# Altium schematic sheet MCU_WASH_MACHINE.SchDoc (part 1 of 3)
size 1270 x 558 mm; SheetNumber: 2; SheetTotal: 2
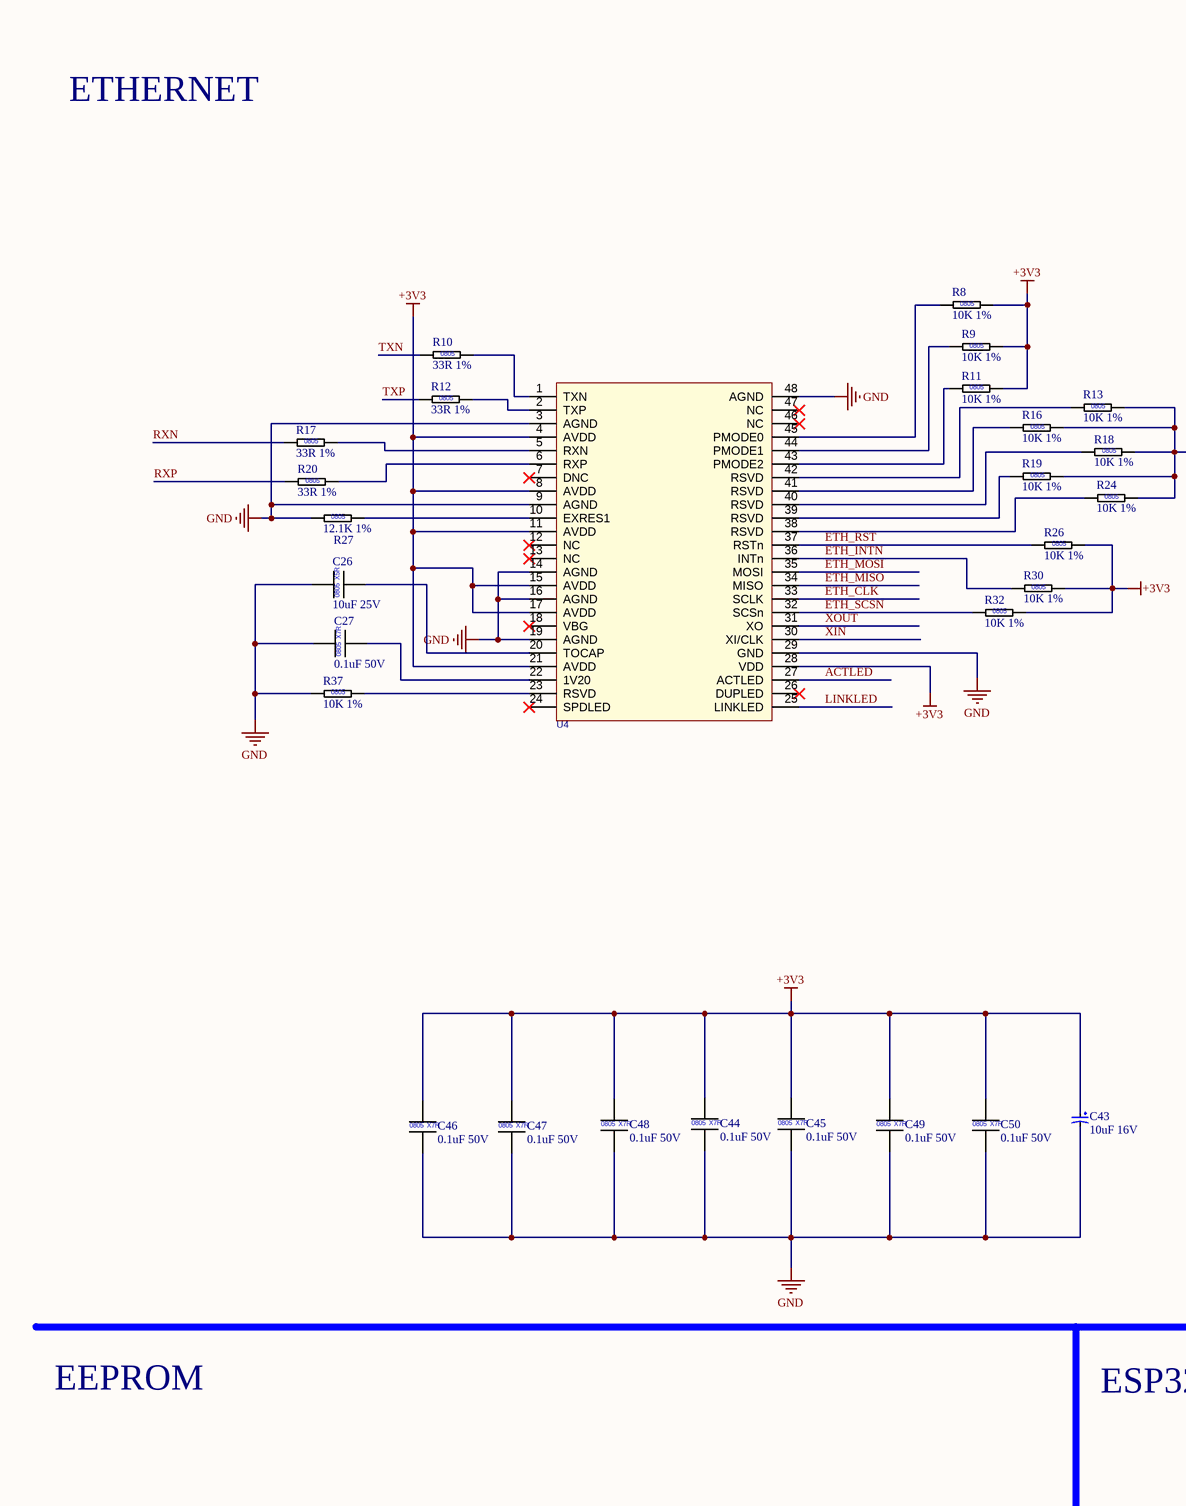
[diagram p0: MCU_WASH_MACHINE.SchDoc, top column 1 of 4]
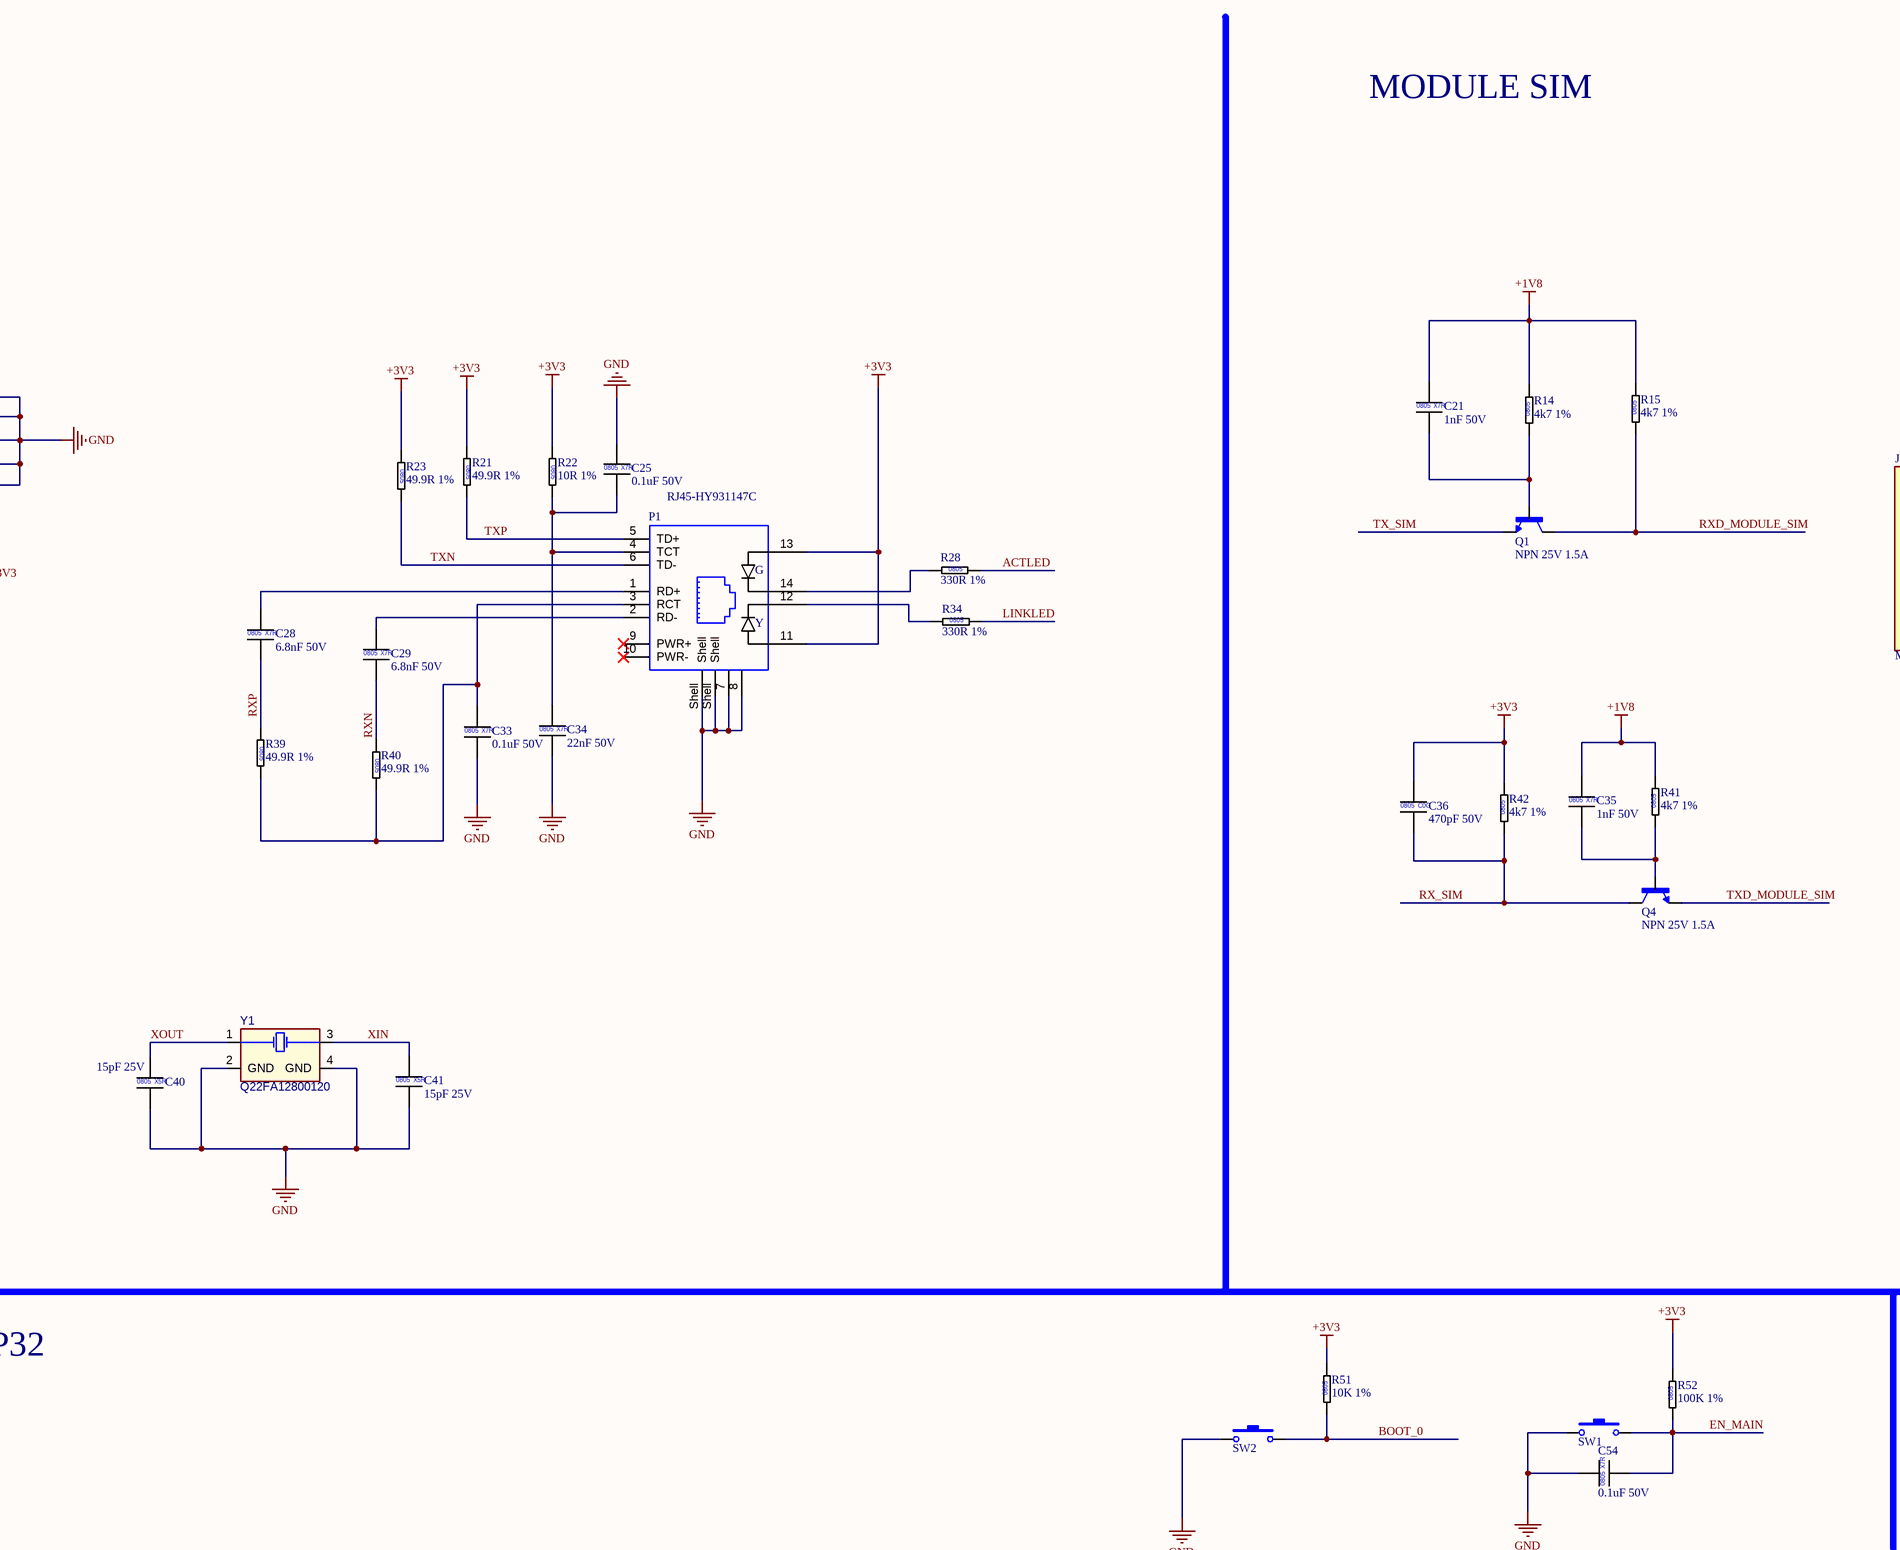
[diagram p1: MCU_WASH_MACHINE.SchDoc, top column 2 of 4]
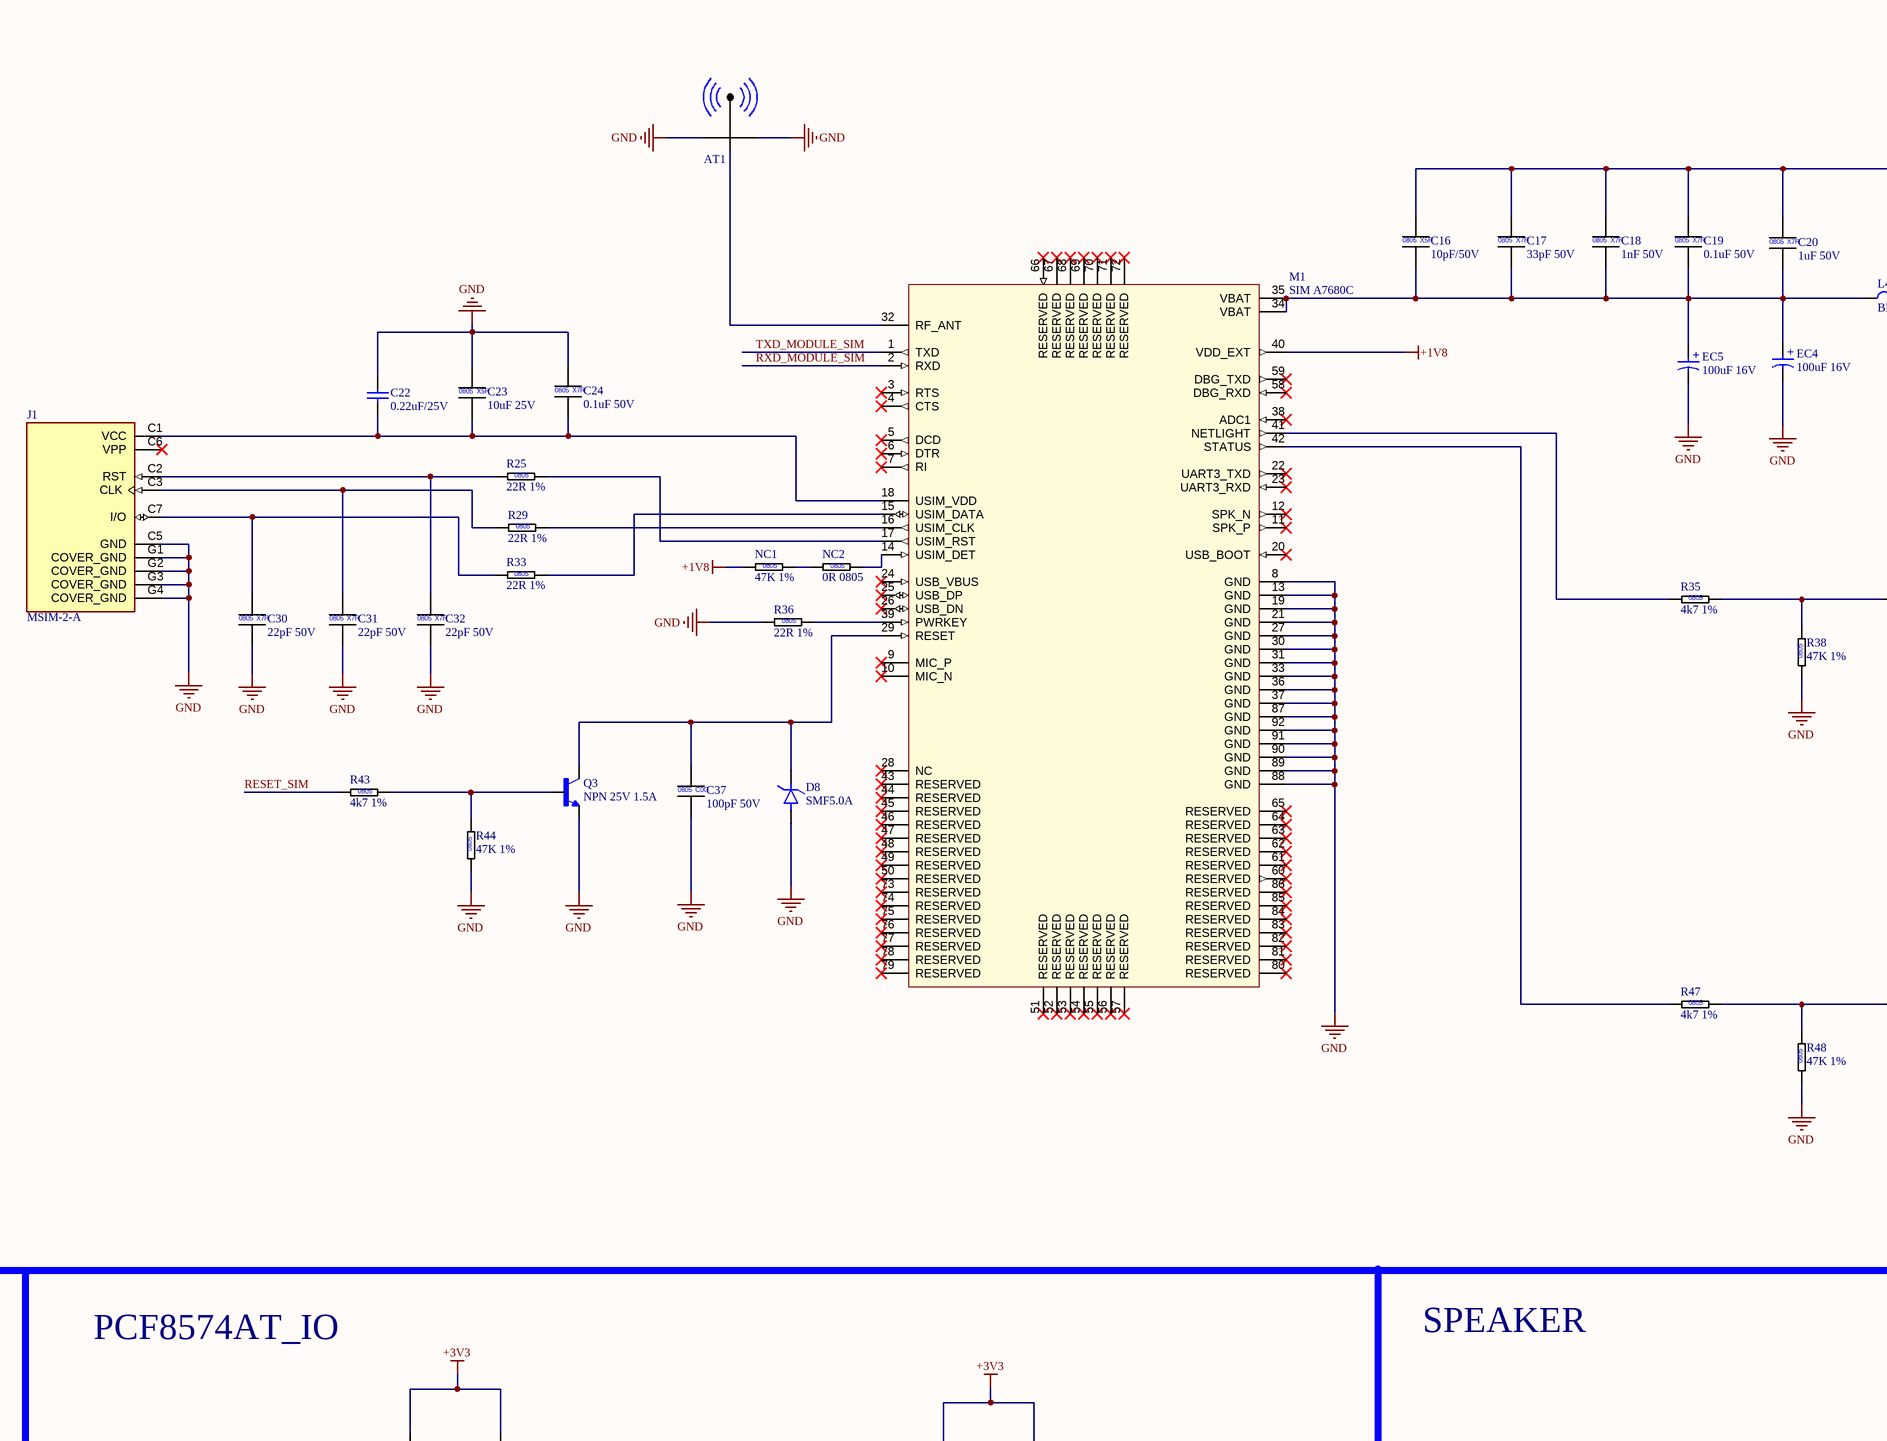
[diagram p2: MCU_WASH_MACHINE.SchDoc, top column 3 of 4]
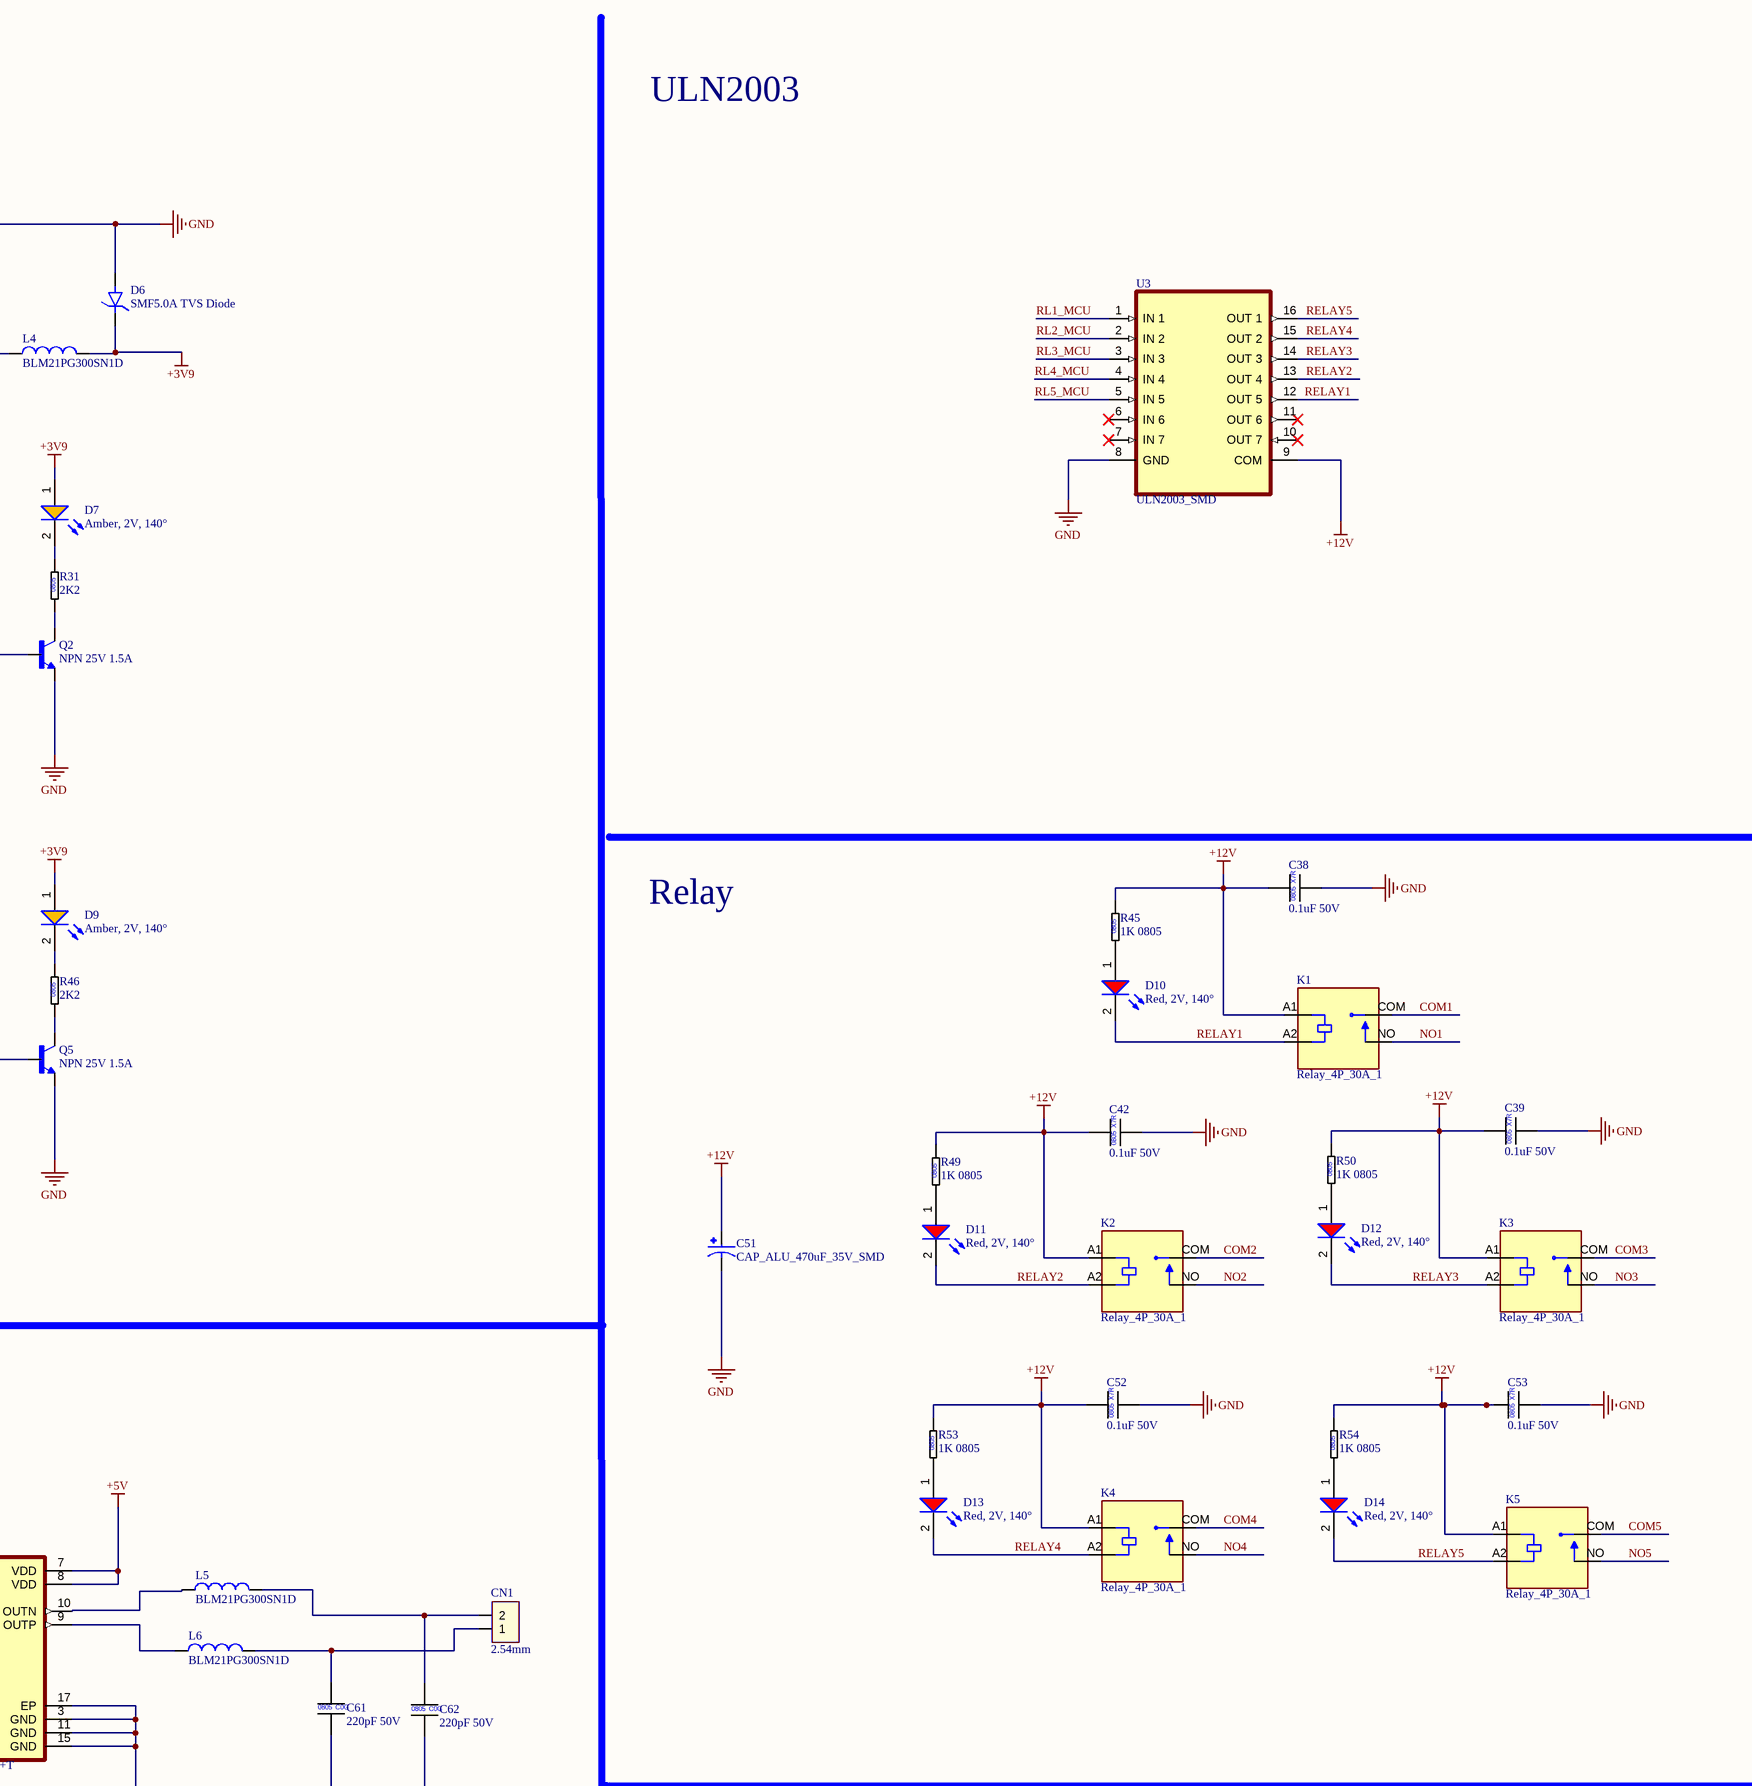
[diagram p3: MCU_WASH_MACHINE.SchDoc, top column 4 of 4]
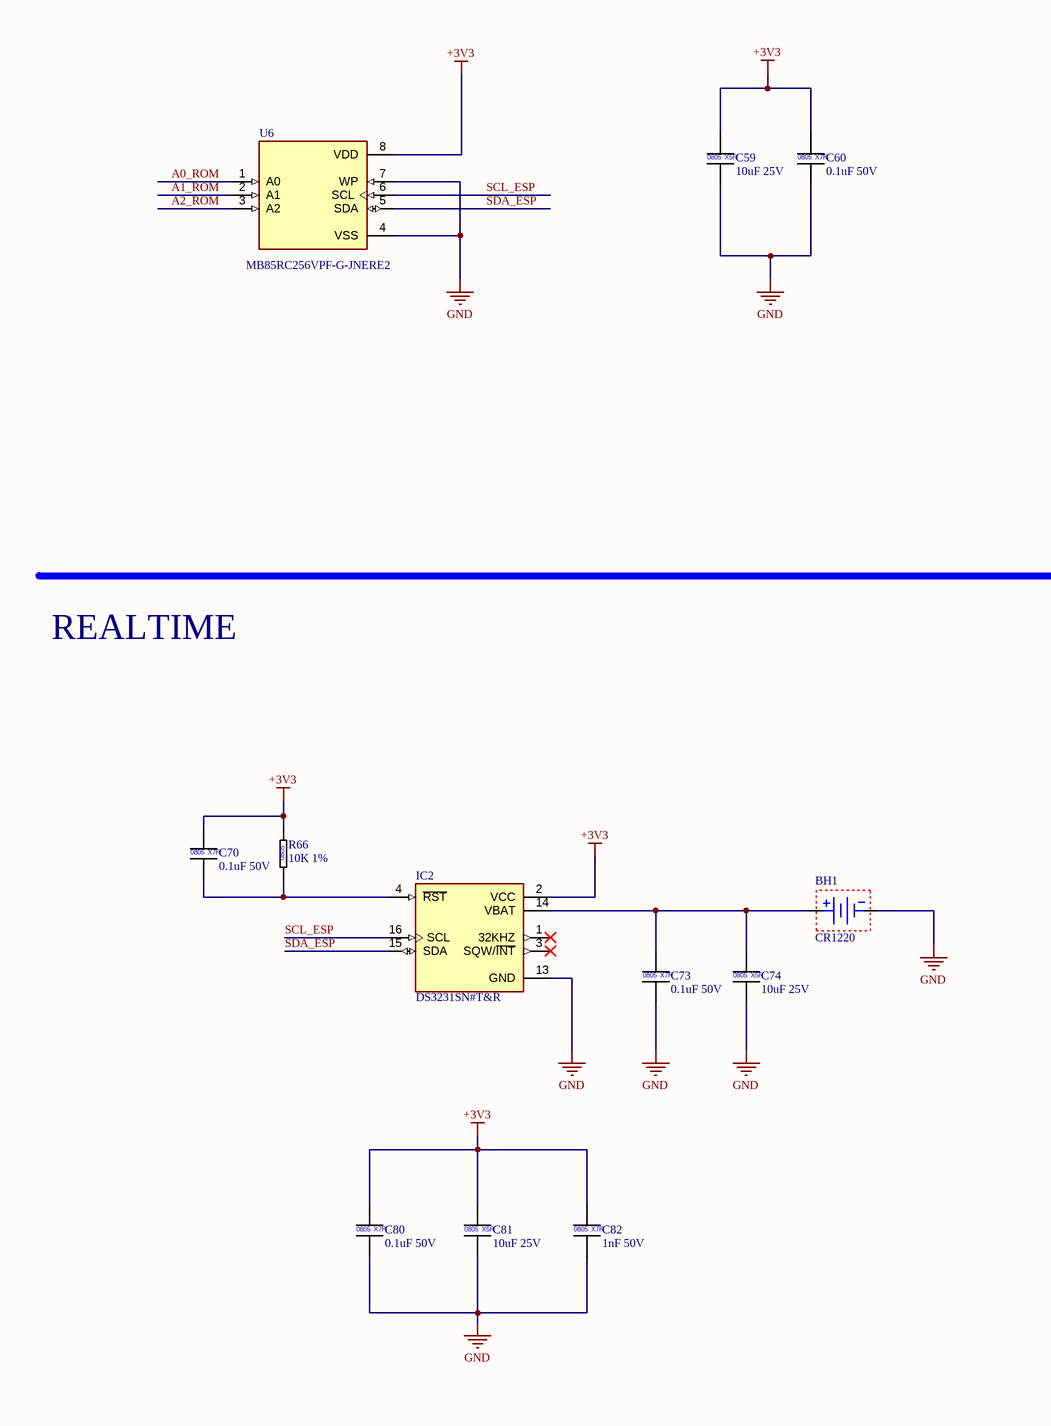
[diagram p4: MCU_WASH_MACHINE.SchDoc, bottom column 1 of 4]
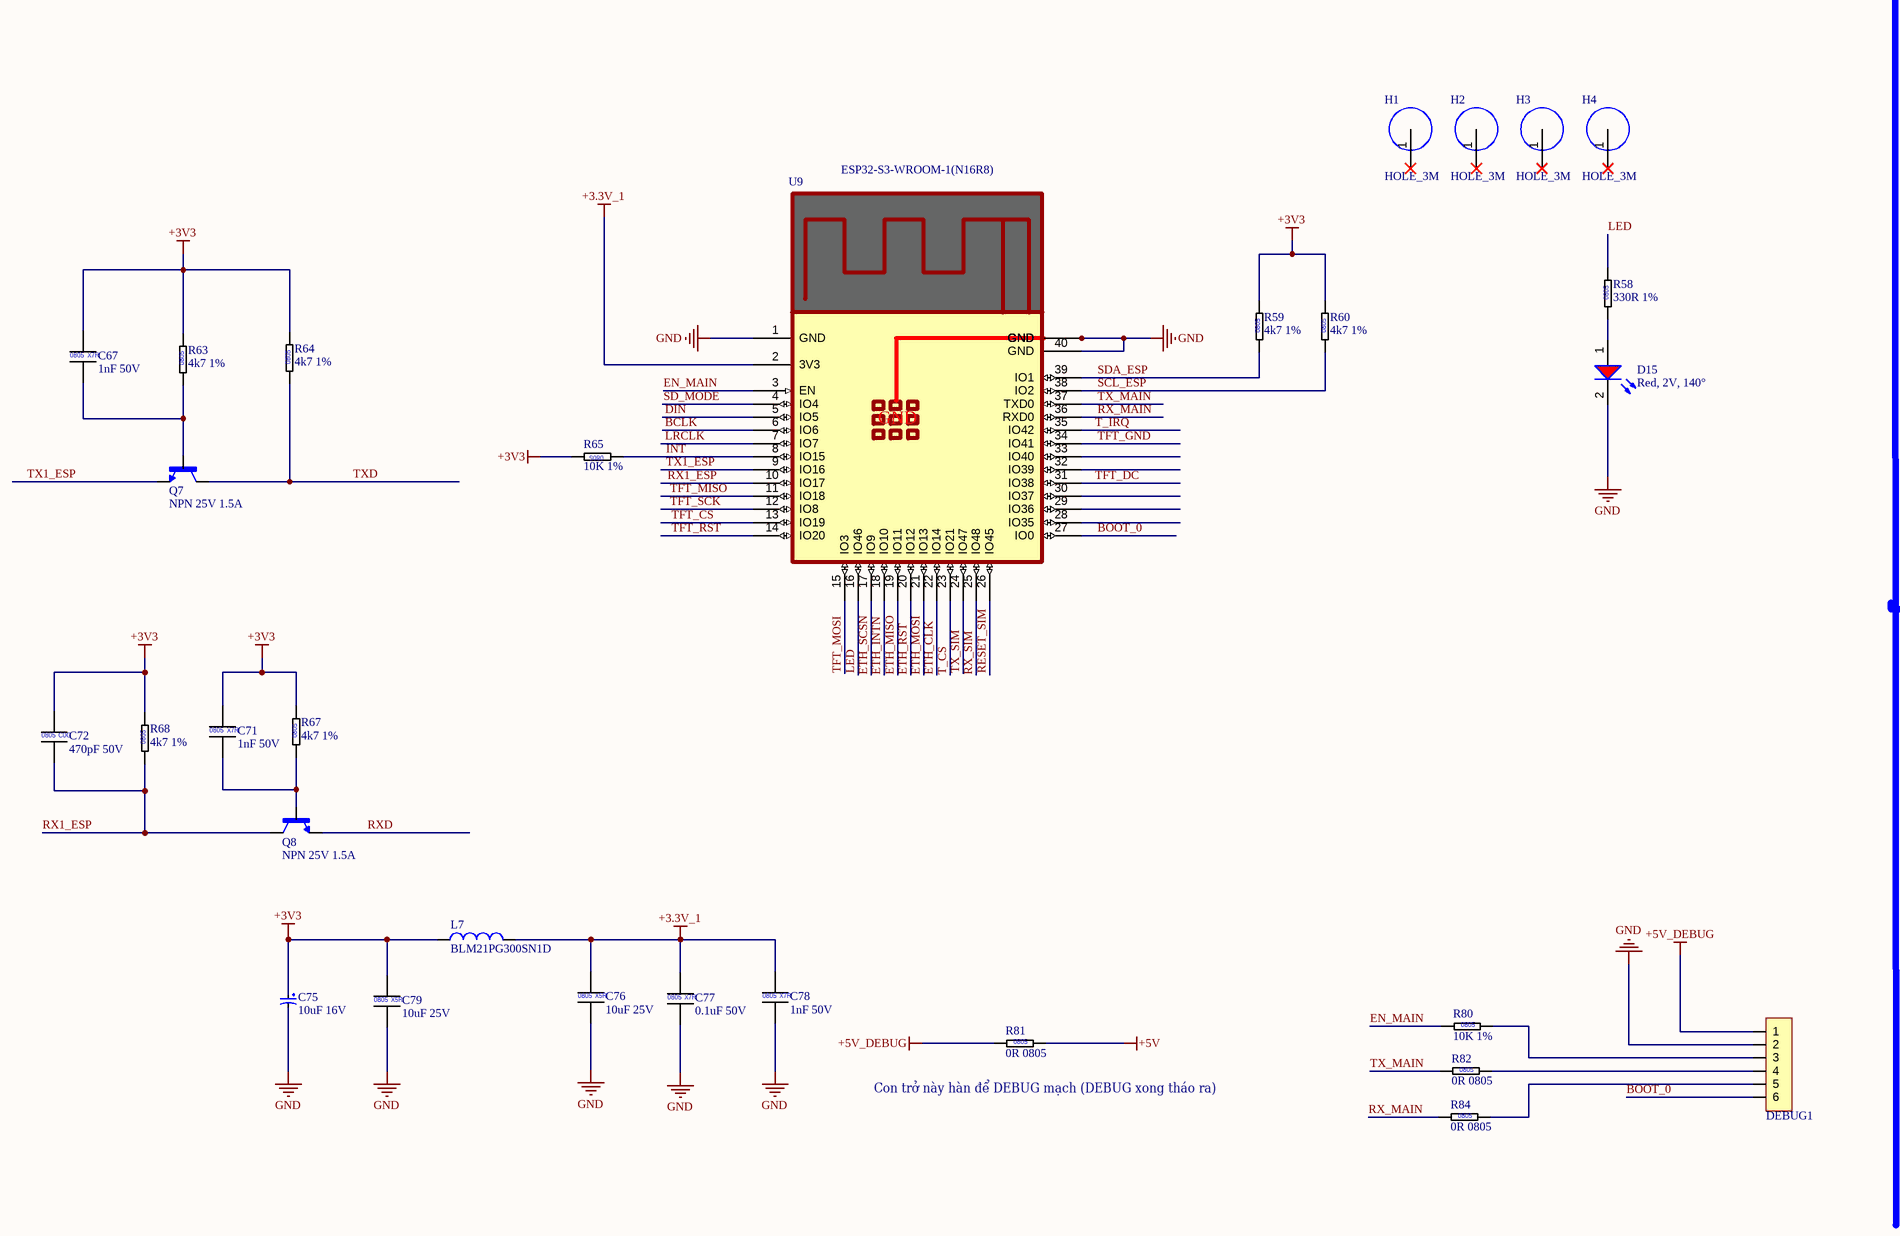
[diagram p5: MCU_WASH_MACHINE.SchDoc, bottom column 2 of 4]
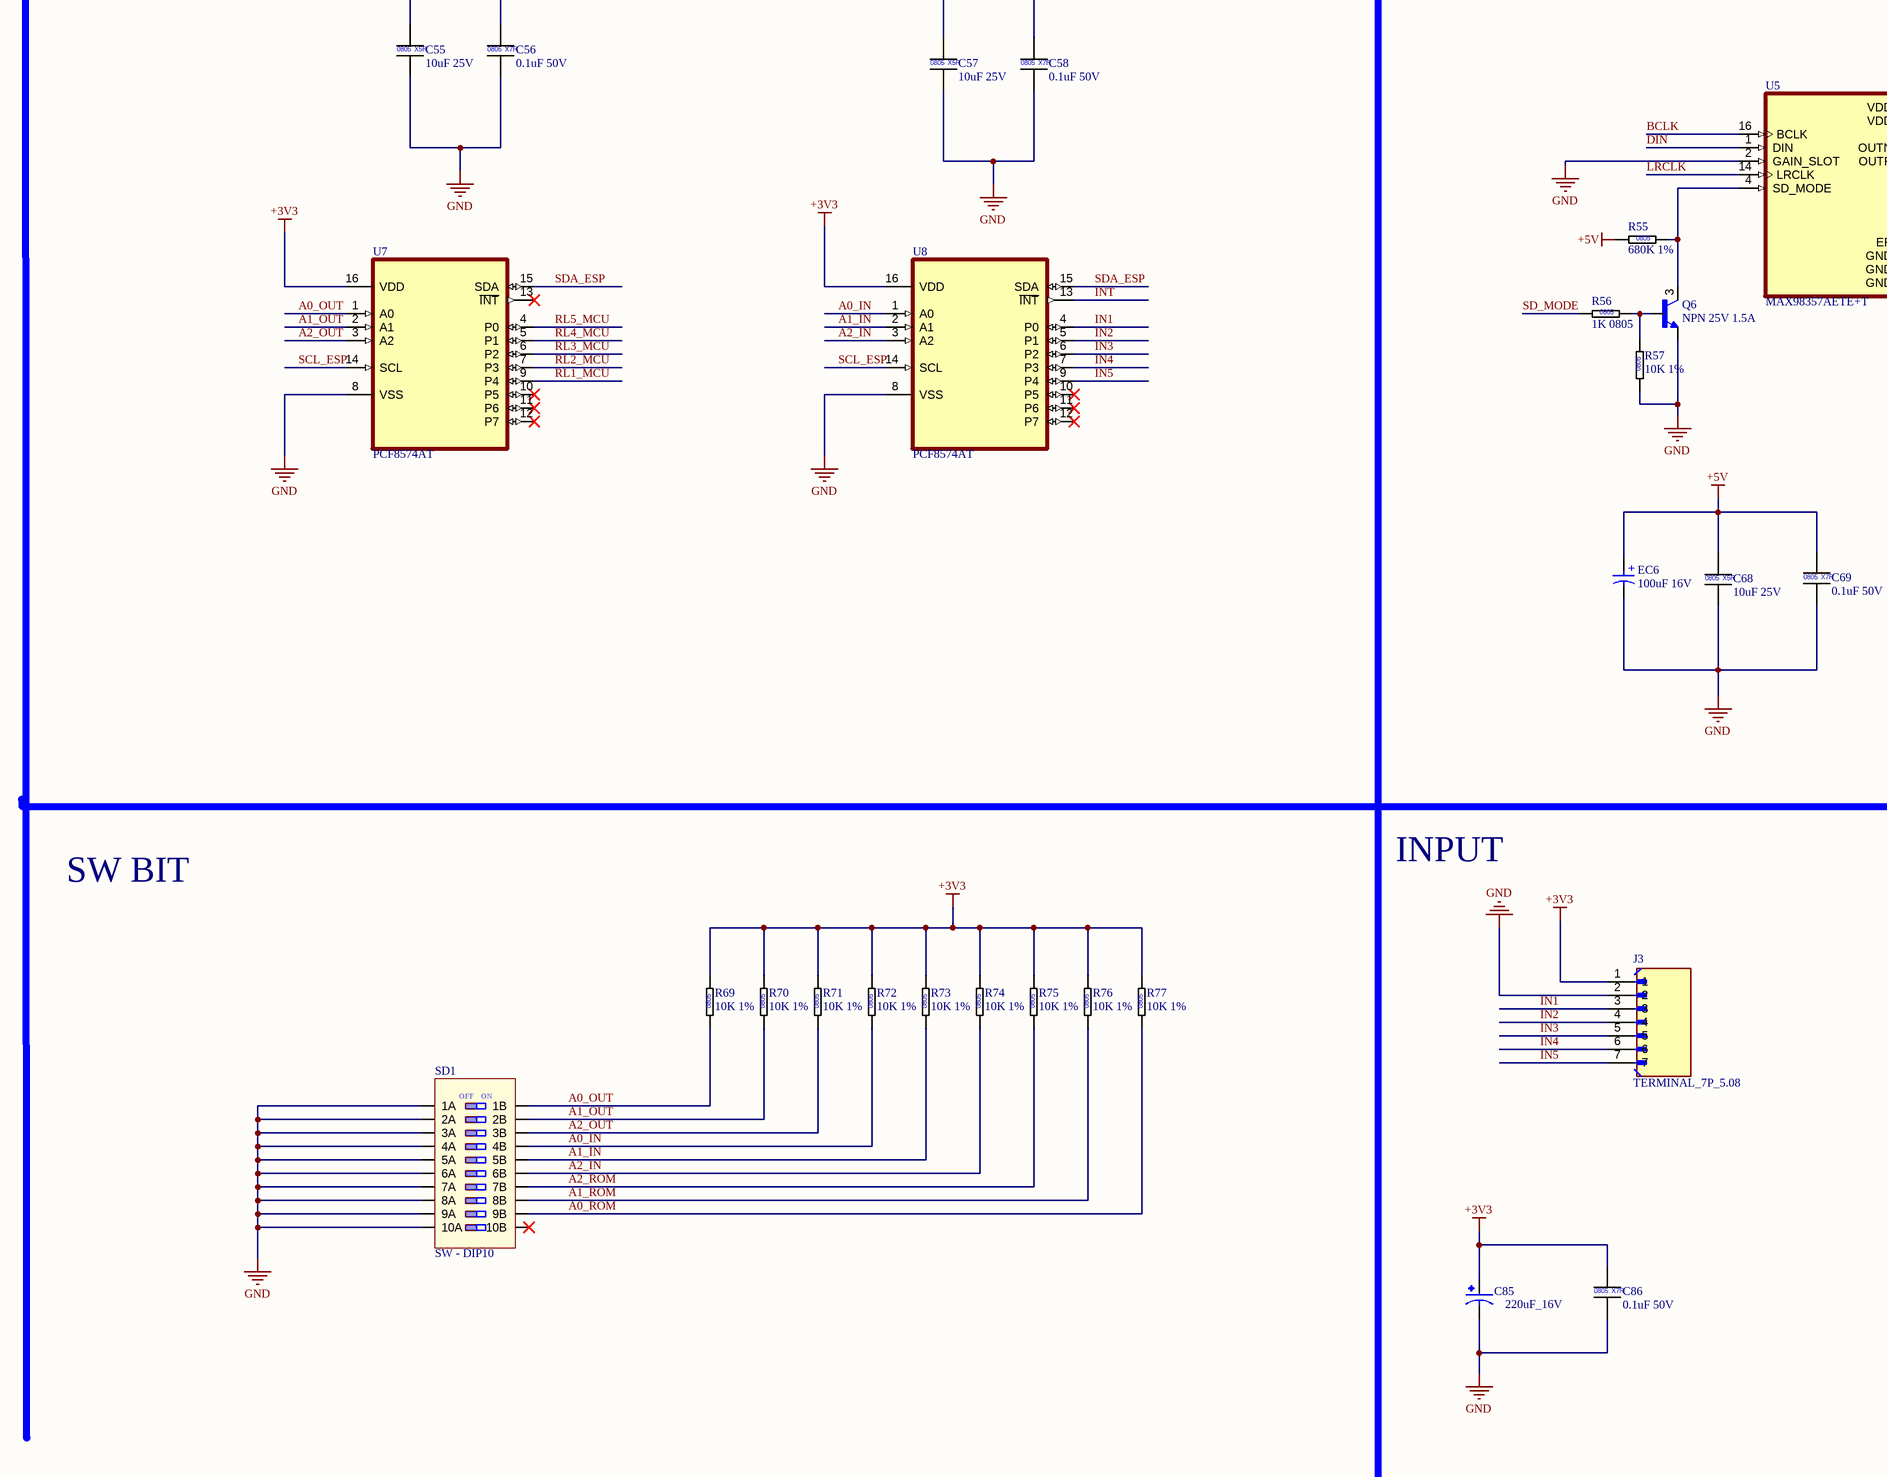
[diagram p6: MCU_WASH_MACHINE.SchDoc, bottom column 3 of 4]
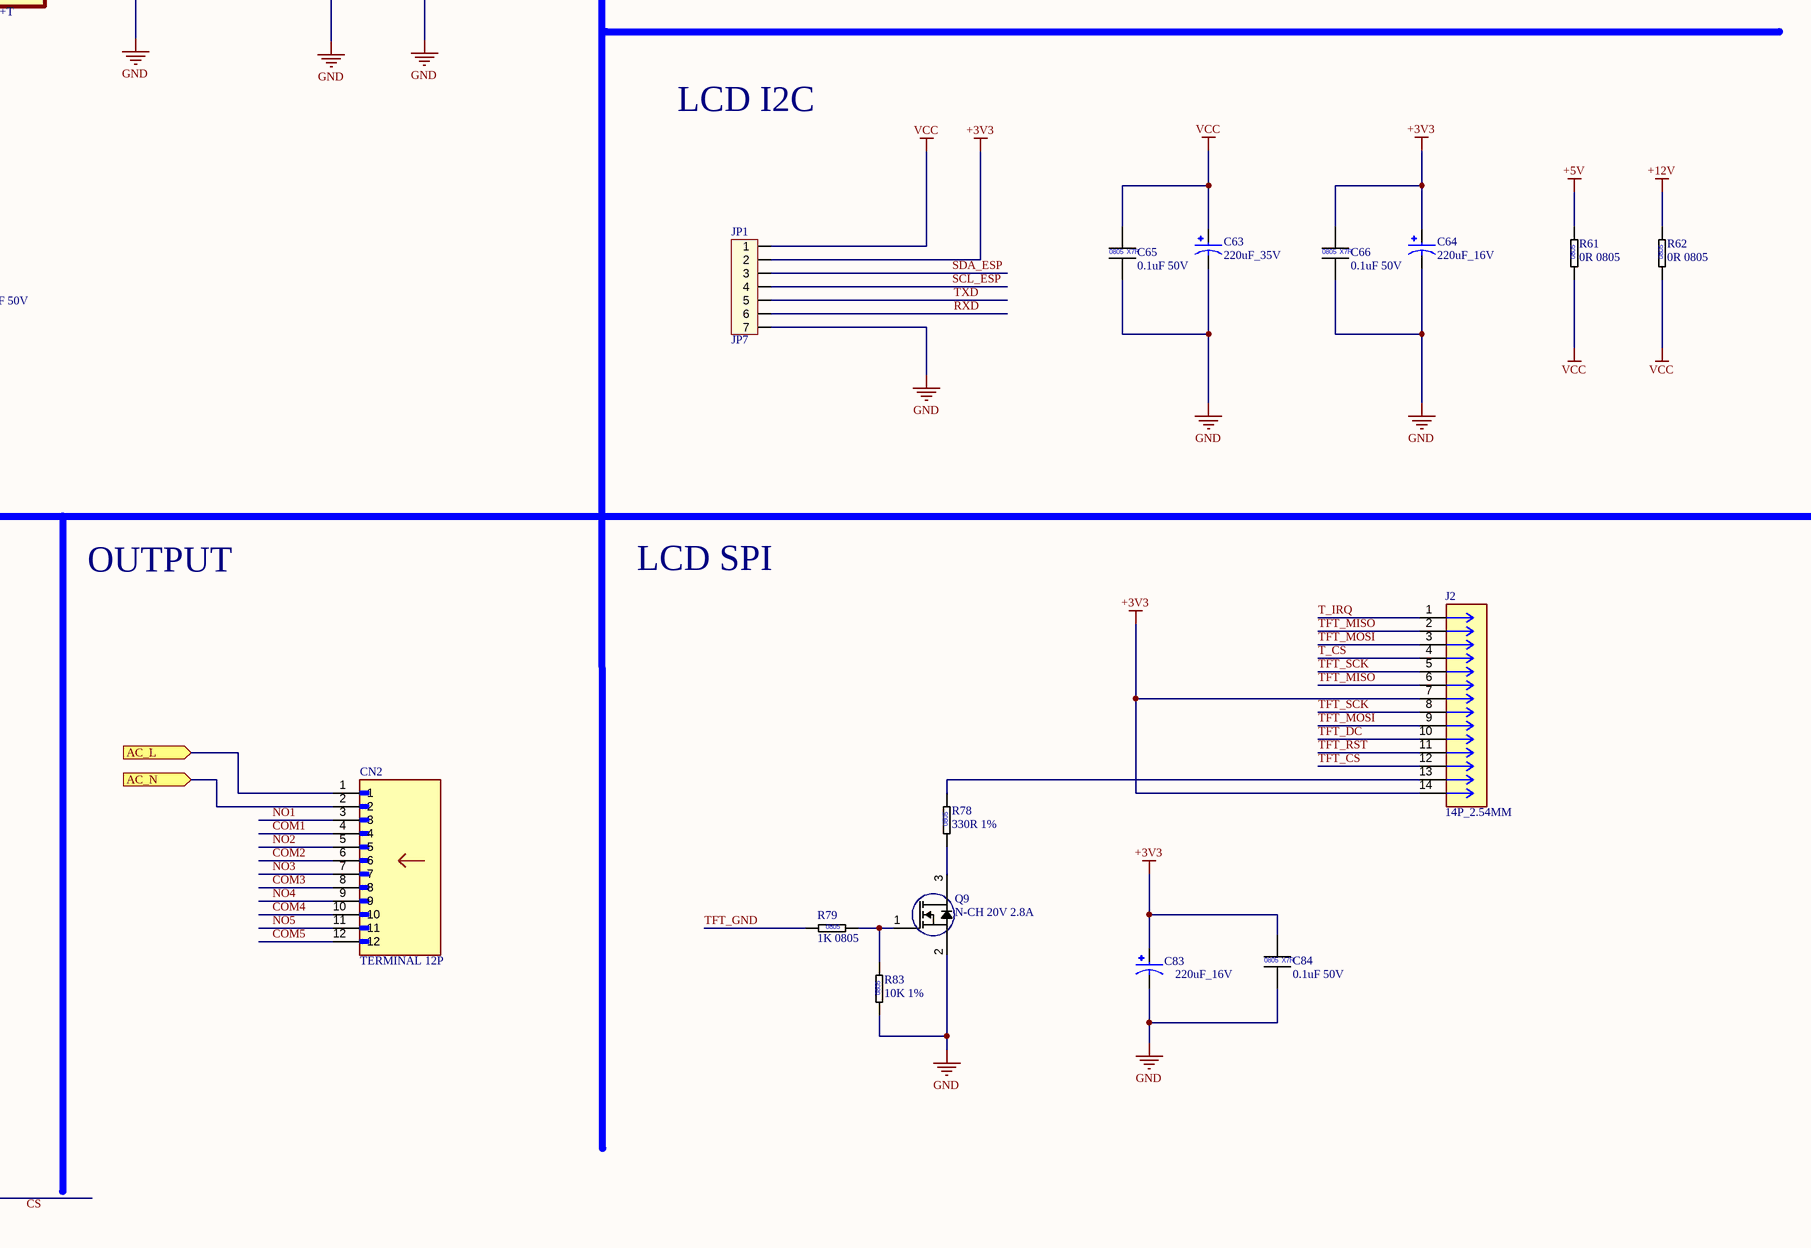
[diagram p7: MCU_WASH_MACHINE.SchDoc, bottom column 4 of 4]

## Parts
AT1  Antenna_IPEX  [IPEX]  (value not drawn)
BH1  CR1220  [BATT_HOLDER_COIL12.5MM]
C16  10pF/50V  [CAP-CER_0805_L2W1.25H0.6_Wave]
C17  33pF 50V  [CAP-CER_0805_L2W1.25H0.6_Wave]
C18  1nF 50V  [CAP-CER_0805_L2W1.25H0.6_Wave]
C19  0.1uF 50V  [CAP-CER_0805_L2W1.25H0.6_Wave]
C20  1uF 50V  [CAP-CER_0805_L2W1.25H0.8_Wave]
C21  1nF 50V  [CAP-CER_0805_L2W1.25H0.6_Wave]
C22  0.22uF/25V  [CAP-CER_0805_L2W1.25H0.6_Wave]
C23  10uF 25V  [CAP-CER_0805_L2W1.25H0.8_Wave]
C24  0.1uF 50V  [CAP-CER_0805_L2W1.25H0.6_Wave]
C25  0.1uF 50V  [CAP-CER_0805_L2W1.25H0.6_Wave]
C26  10uF 25V  [CAP-CER_0805_L2W1.25H0.8_Wave]
C27  0.1uF 50V  [CAP-CER_0805_L2W1.25H0.6_Wave]
C28  6.8nF 50V  [CAP-CER_0805_L2W1.25H0.6_Wave]
C29  6.8nF 50V  [CAP-CER_0805_L2W1.25H0.6_Wave]
C30  22pF 50V  [CAP-CER_0805_L2W1.25H0.6_Wave]
C31  22pF 50V  [CAP-CER_0805_L2W1.25H0.6_Wave]
C32  22pF 50V  [CAP-CER_0805_L2W1.25H0.6_Wave]
C33  0.1uF 50V  [CAP-CER_0805_L2W1.25H0.6_Wave]
C34  22nF 50V  [CAP-CER_0805_L2W1.25H0.6_Wave]
C35  1nF 50V  [CAP-CER_0805_L2W1.25H0.6_Wave]
C36  470pF 50V  [CAP-CER_0805_L2W1.25H0.6_Wave]
C37  100pF 50V  [CAP-CER_0805_L2W1.25H0.6_Wave]
C38  0.1uF 50V  [CAP-CER_0805_L2W1.25H0.6_Wave]
C39  0.1uF 50V  [CAP-CER_0805_L2W1.25H0.6_Wave]
C40  15pF 25V  [CAP-CER_0805_L2W1.25H0.6_Wave]
C41  15pF 25V  [CAP-CER_0805_L2W1.25H0.6_Wave]
C42  0.1uF 50V  [CAP-CER_0805_L2W1.25H0.6_Wave]
C43  10uF 16V  [C-ELEC-ALU-B-D4.0-H5.4-SM]
C44  0.1uF 50V  [CAP-CER_0805_L2W1.25H0.6_Wave]
C45  0.1uF 50V  [CAP-CER_0805_L2W1.25H0.6_Wave]
C46  0.1uF 50V  [CAP-CER_0805_L2W1.25H0.6_Wave]
C47  0.1uF 50V  [CAP-CER_0805_L2W1.25H0.6_Wave]
C48  0.1uF 50V  [CAP-CER_0805_L2W1.25H0.6_Wave]
C49  0.1uF 50V  [CAP-CER_0805_L2W1.25H0.6_Wave]
C50  0.1uF 50V  [CAP-CER_0805_L2W1.25H0.6_Wave]
C51  CAP_ALU_470uF_35V_SMD  [CAP_ALU_470uF_35V]
C52  0.1uF 50V  [CAP-CER_0805_L2W1.25H0.6_Wave]
C53  0.1uF 50V  [CAP-CER_0805_L2W1.25H0.6_Wave]
C54  0.1uF 50V  [CAP-CER_0805_L2W1.25H0.6_Wave]
C55  10uF 25V  [CAP-CER_0805_L2W1.25H0.8_Wave]
C56  0.1uF 50V  [CAP-CER_0805_L2W1.25H0.6_Wave]
C57  10uF 25V  [CAP-CER_0805_L2W1.25H0.8_Wave]
C58  0.1uF 50V  [CAP-CER_0805_L2W1.25H0.6_Wave]
C59  10uF 25V  [CAP-CER_0805_L2W1.25H0.8_Wave]
C60  0.1uF 50V  [CAP-CER_0805_L2W1.25H0.6_Wave]
C61  220pF 50V  [CAP-CER_0805_L2W1.25H0.6_Wave]
C62  220pF 50V  [CAP-CER_0805_L2W1.25H0.6_Wave]
C63  220uF_35V  [C_FC_220UF_35V]
C64  220uF_16V  [CAP ALUM 220UF 20% 16V SMD]
C65  0.1uF 50V  [CAP-CER_0805_L2W1.25H0.6_Wave]
C66  0.1uF 50V  [CAP-CER_0805_L2W1.25H0.6_Wave]
C67  1nF 50V  [CAP-CER_0805_L2W1.25H0.6_Wave]
C68  10uF 25V  [CAP-CER_0805_L2W1.25H0.8_Wave]
C69  0.1uF 50V  [CAP-CER_0805_L2W1.25H0.6_Wave]
C70  0.1uF 50V  [CAP-CER_0805_L2W1.25H0.6_Wave]
C71  1nF 50V  [CAP-CER_0805_L2W1.25H0.6_Wave]
C72  470pF 50V  [CAP-CER_0805_L2W1.25H0.6_Wave]
C73  0.1uF 50V  [CAP-CER_0805_L2W1.25H0.6_Wave]
C74  10uF 25V  [CAP-CER_0805_L2W1.25H0.8_Wave]
C75  10uF 16V  [C-ELEC-ALU-B-D4.0-H5.4-SM]
C76  10uF 25V  [CAP-CER_0805_L2W1.25H0.8_Wave]
C77  0.1uF 50V  [CAP-CER_0805_L2W1.25H0.6_Wave]
C78  1nF 50V  [CAP-CER_0805_L2W1.25H0.6_Wave]
C79  10uF 25V  [CAP-CER_0805_L2W1.25H0.8_Wave]
C80  0.1uF 50V  [CAP-CER_0805_L2W1.25H0.6_Wave]
C81  10uF 25V  [CAP-CER_0805_L2W1.25H0.8_Wave]
C82  1nF 50V  [CAP-CER_0805_L2W1.25H0.6_Wave]
C83  220uF_16V  [CAP ALUM 220UF 20% 16V SMD]
C84  0.1uF 50V  [CAP-CER_0805_L2W1.25H0.6_Wave]
C85  220uF_16V  [CAP ALUM 220UF 20% 16V SMD]
C86  0.1uF 50V  [CAP-CER_0805_L2W1.25H0.6_Wave]
CN1  2.54mm  [2P-2.54mm-DT]
CN2  TERMINAL 12P  [TERMINAL_12P_9.5MM]
D6  SMF5.0A TVS Diode  [SOD-123]
D7  Amber, 2V, 140°  [LED_0805_AMBER]
D8  SMF5.0A  [SOD-123F/SOD-123FL]
D9  Amber, 2V, 140°  [LED_0805_AMBER]
D10  Red, 2V, 140°  [LED_0805_RED]
D11  Red, 2V, 140°  [LED_0805_RED]
D12  Red, 2V, 140°  [LED_0805_RED]
D13  Red, 2V, 140°  [LED_0805_RED]
D14  Red, 2V, 140°  [LED_0805_RED]
D15  Red, 2V, 140°  [LED_0805_RED]
DEBUG1  DEBUG  [JP1x6F-P2.54-TH]  (value not drawn)
EC4  100uF 16V  [CAP_ALU;SMD,D6.3H5.8]
EC5  100uF 16V  [CAP_ALU;SMD,D6.3H5.8]
EC6  100uF 16V  [CAP_ALU;SMD,D6.3H5.8]
H1  HOLE_3M  [HOLE_M3]
H2  HOLE_3M  [HOLE_M3]
H3  HOLE_3M  [HOLE_M3]
H4  HOLE_3M  [HOLE_M3]
IC2  DS3231SN#T&R  [SOIC_16_WIDE]
J1  MSIM-2-A  [MSIM-2-A]
J2  14P_2.54MM  [HEADER_2.54MM_1X7P]
J3  TERMINAL_7P_5.08  [TE_796644-7]
JP1  JP7  [CON7]
K1  Relay_4P_30A_1  [RELAY_4P_PR23-24V-900-1A]
K2  Relay_4P_30A_1  [RELAY_4P_PR23-24V-900-1A]
K3  Relay_4P_30A_1  [RELAY_4P_PR23-24V-900-1A]
K4  Relay_4P_30A_1  [RELAY_4P_PR23-24V-900-1A]
K5  Relay_4P_30A_1  [RELAY_4P_PR23-24V-900-1A]
L4  BLM21PG300SN1D  [L0805]
L5  BLM21PG300SN1D  [L0805]
L6  BLM21PG300SN1D  [L0805]
L7  BLM21PG300SN1D  [L0805]
M1  SIM A7680C  [IC_SIM_A7682S/A7680C - duplicate]
NC1  47K 1%  [RESISTOR_0805_Wave]
NC2  0R 0805  [RESISTOR_0805_Wave]
P1  RJ45-HY931147C  [CONN_TH_RJ45_1PORT_10P_7499111121A]
Q1  NPN 25V 1.5A  [MOS-FET; SOT23]
Q2  NPN 25V 1.5A  [MOS-FET; SOT23]
Q3  NPN 25V 1.5A  [MOS-FET; SOT23]
Q4  NPN 25V 1.5A  [MOS-FET; SOT23]
Q5  NPN 25V 1.5A  [MOS-FET; SOT23]
Q6  NPN 25V 1.5A  [MOS-FET; SOT23]
Q7  NPN 25V 1.5A  [MOS-FET; SOT23]
Q8  NPN 25V 1.5A  [MOS-FET; SOT23]
Q9  N-CH 20V 2.8A  [MOS-FET; SOT23]
R8  10K 1%  [RESISTOR_0805_Wave]
R9  10K 1%  [RESISTOR_0805_Wave]
R10  33R 1%  [RESISTOR_0805_Wave]
R11  10K 1%  [RESISTOR_0805_Wave]
R12  33R 1%  [RESISTOR_0805_Wave]
R13  10K 1%  [RESISTOR_0805_Wave]
R14  4k7 1%  [RESISTOR_0805_Wave]
R15  4k7 1%  [RESISTOR_0805_Wave]
R16  10K 1%  [RESISTOR_0805_Wave]
R17  33R 1%  [RESISTOR_0805_Wave]
R18  10K 1%  [RESISTOR_0805_Wave]
R19  10K 1%  [RESISTOR_0805_Wave]
R20  33R 1%  [RESISTOR_0805_Wave]
R21  49.9R 1%  [RESISTOR_0805_Wave]
R22  10R 1%  [RESISTOR_0805_Wave]
R23  49.9R 1%  [RESISTOR_0805_Wave]
R24  10K 1%  [RESISTOR_0805_Wave]
R25  22R 1%  [RESISTOR_0805_Wave]
R26  10K 1%  [RESISTOR_0805_Wave]
R27  12.1K 1%  [RESISTOR_0805_Wave]
R28  330R 1%  [RESISTOR_0805_Wave]
R29  22R 1%  [RESISTOR_0805_Wave]
R30  10K 1%  [RESISTOR_0805_Wave]
R31  2K2  [RESISTOR_0805_Wave]
R32  10K 1%  [RESISTOR_0805_Wave]
R33  22R 1%  [RESISTOR_0805_Wave]
R34  330R 1%  [RESISTOR_0805_Wave]
R35  4k7 1%  [RESISTOR_0805_Wave]
R36  22R 1%  [RESISTOR_0805_Wave]
R37  10K 1%  [RESISTOR_0805_Wave]
R38  47K 1%  [RESISTOR_0805_Wave]
R39  49.9R 1%  [RESISTOR_0805_Wave]
R40  49.9R 1%  [RESISTOR_0805_Wave]
R41  4k7 1%  [RESISTOR_0805_Wave]
R42  4k7 1%  [RESISTOR_0805_Wave]
R43  4k7 1%  [RESISTOR_0805_Wave]
R44  47K 1%  [RESISTOR_0805_Wave]
R45  1K 0805  [RESISTOR_0805_Wave]
R46  2K2  [RESISTOR_0805_Wave]
R47  4k7 1%  [RESISTOR_0805_Wave]
R48  47K 1%  [RESISTOR_0805_Wave]
R49  1K 0805  [RESISTOR_0805_Wave]
R50  1K 0805  [RESISTOR_0805_Wave]
R51  10K 1%  [RESISTOR_0805_Wave]
R52  100K 1%  [RESISTOR_0805_Wave]
R53  1K 0805  [RESISTOR_0805_Wave]
R54  1K 0805  [RESISTOR_0805_Wave]
R55  680K 1%  [RESISTOR_0805_Wave]
R56  1K 0805  [RESISTOR_0805_Wave]
R57  10K 1%  [RESISTOR_0805_Wave]
R58  330R 1%  [RESISTOR_0805_Wave]
R59  4k7 1%  [RESISTOR_0805_Wave]
R60  4k7 1%  [RESISTOR_0805_Wave]
R61  0R 0805  [RESISTOR_0805_Wave]
R62  0R 0805  [RESISTOR_0805_Wave]
R63  4k7 1%  [RESISTOR_0805_Wave]
R64  4k7 1%  [RESISTOR_0805_Wave]
R65  10K 1%  [RESISTOR_0805_Wave]
R66  10K 1%  [RESISTOR_0805_Wave]
R67  4k7 1%  [RESISTOR_0805_Wave]
R68  4k7 1%  [RESISTOR_0805_Wave]
R69  10K 1%  [RESISTOR_0805_Wave]
R70  10K 1%  [RESISTOR_0805_Wave]
R71  10K 1%  [RESISTOR_0805_Wave]
R72  10K 1%  [RESISTOR_0805_Wave]
R73  10K 1%  [RESISTOR_0805_Wave]
R74  10K 1%  [RESISTOR_0805_Wave]
R75  10K 1%  [RESISTOR_0805_Wave]
R76  10K 1%  [RESISTOR_0805_Wave]
R77  10K 1%  [RESISTOR_0805_Wave]
R78  330R 1%  [RESISTOR_0805_Wave]
R79  1K 0805  [RESISTOR_0805_Wave]
R80  10K 1%  [RESISTOR_0805_Wave]
R81  0R 0805  [RESISTOR_0805_Wave]
R82  0R 0805  [RESISTOR_0805_Wave]
R83  10K 1%  [RESISTOR_0805_Wave]
R84  0R 0805  [RESISTOR_0805_Wave]
SD1  SW - DIP10  [SW_DS01C-254-S-10BE]
SW1  Nut Nhan 2 Chan SMD 3x6x2.5  [Nut Nhan 2 Chan SMD 3x6x2.5]  (value not drawn)
SW2  Nut Nhan 2 Chan SMD 3x6x2.5  [Nut Nhan 2 Chan SMD 3x6x2.5]  (value not drawn)
U3  ULN2003_SMD  [ULN2003]
U4  W5500  [IC_48LQFP]  (value not drawn)
U5  MAX98357AETE+T  [QFN50P300X300X80-17N]
U6  MB85RC256VPF-G-JNERE2  [SOP8]
U7  PCF8574AT  [SOIC127P1032X265-16N]
U8  PCF8574AT  [SOIC127P1032X265-16N]
U9  ESP32-S3-WROOM-1(N16R8)  [ESP32-S3-WROOM-1]
Y1  Q22FA12800120  [ABM10]

## Ports
AC_L (in), AC_N (in)

## Nets
+1V8: C21.1 C35.1 M1.40(VDD_EXT) NC1.1 R14.2 R15.2 R41.2
+3.3V_1: C76.1 C77.1 C78.1 L7.2 U9.2(3V3)
+3V3: C36.1 C43.1 C44.1 C45.1 C46.1 C47.1 C48.1 C49.1 C50.1 C55.1 C56.1 C57.1 C58.1 C59.1 C60.1 C64.1 C66.1 C67.1 C70.1 C71.1 C72.1 C75.1 C79.1 C80.1 C81.1 C82.1 C83.1 C84.1 C85.1 C86.1 IC2.2(VCC) J2.7 J2.14 J3.1 JP1.2 L7.1 P1.11(A1) P1.13(K2) R8.2 R9.2 R11.2 R21.1 R22.1 R23.1 R26.2 R30.2 R32.2 R42.2 R51.2 R52.2 R59.2 R60.2 R63.2 R64.2 R65.2 R66.2 R67.2 R68.2 R69.2 R70.2 R71.2 R72.2 R73.2 R74.2 R75.2 R76.2 R77.2 U4.4(AVDD) U4.8(AVDD) U4.11(AVDD) U4.15(AVDD) U4.17(AVDD) U4.21(AVDD) U4.28(VDD) U6.8(VDD) U7.16(VDD) U8.16(VDD)
+3V9: D6.2(K) D7.1(A) D9.1(A) L4.2
+5V: C68.1 C69.1 EC6.1(P) R55.1 R61.2 R81.2 U5.7(VDD) U5.8(VDD)
+5V_DEBUG: DEBUG1.1 R81.1
+12V: C38.1 C39.1 C42.1 C51.1 C52.1 C53.1 K1.A1(COIL1) K2.A1(COIL1) K3.A1(COIL1) K4.A1(COIL1) K5.A1(COIL1) R45.2 R49.2 R50.2 R53.2 R54.2 R62.2 U3.9(COM)
GND: AT1.2(GND) BH1.2(NEG) C16.1 C17.1 C18.1 C19.1 C20.1 C22.2 C23.1 C24.1 C25.1 C26.1 C27.1 C30.2 C31.2 C32.2 C33.2 C34.2 C37.2 C38.2 C39.2 C40.2 C41.2 C42.2 C43.2 C44.2 C45.2 C46.2 C47.2 C48.2 C49.2 C50.2 C51.2 C52.2 C53.2 C54.1 C55.2 C56.2 C57.2 C58.2 C59.2 C60.2 C61.2 C62.2 C63.2 C64.2 C65.2 C66.2 C68.2 C69.2 C73.2 C74.2 C75.2 C76.2 C77.2 C78.2 C79.2 C80.2 C81.2 C82.2 C83.2 C84.2 C85.2 C86.2 D6.1(A) D8.1(A) D15.2(K) DEBUG1.2 EC4.2(N) EC5.2(N) EC6.2(N) IC2.13(GND) J1.C5(GND) J1.G1(COVER_GND) J1.G2(COVER_GND) J1.G3(COVER_GND) J1.G4(COVER_GND) J3.2 JP1.7 M1.8(GND) M1.13(GND) M1.19(GND) M1.21(GND) M1.27(GND) M1.30(GND) M1.31(GND) M1.33(GND) M1.36(GND) M1.37(GND) M1.87(GND) M1.88(GND) M1.89(GND) M1.90(GND) M1.91(GND) M1.92(GND) P1.7 P1.8 P1.Shell Q2.2(E) Q3.2(E) Q5.2(E) Q6.2(E) Q9.2(S) R13.2 R16.2 R18.2 R19.2 R24.2 R27.1 R36.1 R37.1 R38.1 R44.1 R48.1 R57.1 R83.1 SD1.1A SD1.2A SD1.3A SD1.4A SD1.5A SD1.6A SD1.7A SD1.8A SD1.9A SD1.10A SW1.1 SW2.1 U3.8(GND) U4.3(AGND) U4.9(AGND) U4.14(AGND) U4.16(AGND) U4.19(AGND) U4.29(GND) U4.48(AGND) U5.2(GAIN_SLOT) U5.3(GND) U5.11(GND) U5.15(GND) U5.17(EP) U6.4(VSS) U6.7(WP) U7.8(VSS) U8.8(VSS) U9.1(GND) U9.40(GND) U9.41(GND) U9.42(GND) U9.43(GND) U9.44(GND) U9.45(GND) U9.46(GND) U9.47(GND) U9.48(GND) U9.49(GND) Y1.2(GND) Y1.4(GND)
VCC: C63.1 C65.1 JP1.1 R61.1 R62.1
A0_IN: R72.1 SD1.4B U8.1(A0)
A0_OUT: R69.1 SD1.1B U7.1(A0)
A0_ROM: R77.1 SD1.9B U6.1(A0)
A1_IN: R73.1 SD1.5B U8.2(A1)
A1_OUT: R70.1 SD1.2B U7.2(A1)
A1_ROM: R76.1 SD1.8B U6.2(A1)
A2_IN: R74.1 SD1.6B U8.3(A2)
A2_OUT: R71.1 SD1.3B U7.3(A2)
A2_ROM: R75.1 SD1.7B U6.3(A2)
AC_L: CN2.1 ; port AC_L
AC_N: CN2.2 ; port AC_N
ACTLED: R28.2 U4.27(ACTLED)
BCLK: U5.16(BCLK) U9.6(IO6)
BOOT_0: DEBUG1.6 R51.1 SW2.2 U9.27(IO0)
COM1: CN2.4 K1.COM
COM2: CN2.6 K2.COM
COM3: CN2.8 K3.COM
COM4: CN2.10 K4.COM
COM5: CN2.12 K5.COM
DIN: U5.1(DIN) U9.5(IO5)
EN_MAIN: C54.2 R52.1 R80.1 SW1.2 U9.3(EN)
ETH_CLK: U4.33(SCLK) U9.22(IO14)
ETH_INTN: R30.1 U4.36(INTn) U9.18(IO10)
ETH_MISO: U4.34(MISO) U9.19(IO11)
ETH_MOSI: U4.35(MOSI) U9.21(IO13)
ETH_RST: R26.1 U4.37(RSTn) U9.20(IO12)
ETH_SCSN: R32.1 U4.32(SCSn) U9.17(IO9)
IN1: J3.3 U8.4(P0)
IN2: J3.4 U8.5(P1)
IN3: J3.5 U8.6(P2)
IN4: J3.6 U8.7(P3)
IN5: J3.7 U8.9(P4)
INT: R65.1 U8.13(~{INT}) U9.8(IO15)
LED: R58.2 U9.16(IO46)
LINKLED: R34.2 U4.25(LINKLED)
LRCLK: U5.14(LRCLK) U9.7(IO7)
NO1: CN2.3 K1.NO
NO2: CN2.5 K2.NO
NO3: CN2.7 K3.NO
NO4: CN2.9 K4.NO
NO5: CN2.11 K5.NO
RELAY1: D10.2(K) K1.A2(COIL2) U3.12(OUT_5)
RELAY2: D11.2(K) K2.A2(COIL2) U3.13(OUT_4)
RELAY3: D12.2(K) K3.A2(COIL2) U3.14(OUT_3)
RELAY4: D13.2(K) K4.A2(COIL2) U3.15(OUT_2)
RELAY5: D14.2(K) K5.A2(COIL2) U3.16(OUT_1)
RESET_SIM: R43.1 U9.26(IO45)
RL1_MCU: U3.1(IN_1) U7.9(P4)
RL2_MCU: U3.2(IN_2) U7.7(P3)
RL3_MCU: U3.3(IN_3) U7.6(P2)
RL4_MCU: U3.4(IN_4) U7.5(P1)
RL5_MCU: U3.5(IN_5) U7.4(P0)
RX1_ESP: C72.2 Q8.3(C) R68.1 U9.10(IO17)
RX_MAIN: R84.1 U9.36(RXD0)
RX_SIM: C36.2 Q4.3(C) R42.1 U9.25(IO48)
RXD: JP1.6 Q8.2(E)
RXD_MODULE_SIM: M1.2(RXD) Q1.3(C) R15.1
RXN: C29.2 R17.1 R40.1
RXP: C28.2 R20.1 R39.1
SCL_ESP: IC2.16(SCL) JP1.4 R60.1 U6.6(SCL) U7.14(SCL) U8.14(SCL) U9.38(IO2)
SD_MODE: R56.1 U9.4(IO4)
SDA_ESP: IC2.15(SDA) JP1.3 R59.1 U6.5(SDA) U7.15(SDA) U8.15(SDA) U9.39(IO1)
T_CS: J2.4 U9.23(IO21)
T_IRQ: J2.1 U9.35(IO42)
TFT_CS: J2.12 U9.13(IO19)
TFT_DC: J2.10 U9.31(IO38)
TFT_GND: R79.1 U9.34(IO41)
TFT_MISO: J2.2 J2.6 U9.11(IO18)
TFT_MOSI: J2.3 J2.9 U9.15(IO3)
TFT_RST: J2.11 U9.14(IO20)
TFT_SCK: J2.5 J2.8 U9.12(IO8)
TX1_ESP: Q7.2(E) U9.9(IO16)
TX_MAIN: R82.1 U9.37(TXD0)
TX_SIM: Q1.2(E) U9.24(IO47)
TXD: JP1.5 Q7.3(C) R64.1
TXD_MODULE_SIM: M1.1(TXD) Q4.2(E)
TXN: P1.6(TD-) R10.1 R23.2
TXP: P1.5(TD+) R12.1 R21.2
XIN: C41.1 U4.30(XI/CLK) Y1.3(X2)
XOUT: C40.1 U4.31(XO) Y1.1(X1)
NetAT1_1: AT1.1(AT) M1.32(RF_ANT)
NetBH1_1: BH1.1(POS) C73.1 C74.1 IC2.14(VBAT)
NetC16_2: C16.2 C17.2 C18.2 C19.2 C20.2 EC4.1(P) EC5.1(P) L4.1 M1.34(VBAT) M1.35(VBAT)
NetC21_2: C21.2 Q1.1(B) R14.1
NetC22_1: C22.1 C23.2 C24.2 J1.C1(VCC) M1.18(USIM_VDD)
NetC25_2: C25.2 C34.1 P1.4(TCT) R22.2
NetC26_2: C26.2 U4.20(TOCAP)
NetC27_2: C27.2 U4.22(1V20)
NetC28_1: C28.1 P1.1(RD+)
NetC29_1: C29.1 P1.2(RD-)
NetC30_1: C30.1 J1.C7(I/O) R33.1
NetC31_1: C31.1 J1.C3(CLK) R29.1
NetC32_1: C32.1 J1.C2(RST) R25.1
NetC33_1: C33.1 P1.3(RCT) R39.2 R40.2
NetC35_2: C35.2 Q4.1(B) R41.1
NetC37_1: C37.1 D8.2(K) M1.29(RESET) Q3.3(C)
NetC61_1: C61.1 CN1.1 L6.2
NetC62_1: C62.1 CN1.2 L5.2
NetC67_2: C67.2 Q7.1(B) R63.1
NetC70_2: C70.2 IC2.4(~{RST}) R66.1
NetC71_2: C71.2 Q8.1(B) R67.1
NetD7_2: D7.2(K) R31.2
NetD9_2: D9.2(K) R46.2
NetD10_1: D10.1(A) R45.1
NetD11_1: D11.1(A) R49.1
NetD12_1: D12.1(A) R50.1
NetD13_1: D13.1(A) R53.1
NetD14_1: D14.1(A) R54.1
NetD15_1: D15.1(A) R58.1
NetDEBUG1_3: DEBUG1.3 R80.2
NetDEBUG1_4: DEBUG1.4 R82.2
NetDEBUG1_5: DEBUG1.5 R84.2
NetJ2_13: J2.13 R78.2
NetL5_1: L5.1 U5.10(OUTN)
NetL6_1: L6.1 U5.9(OUTP)
NetM1_14: M1.14(USIM_DET) NC2.2
NetM1_15: M1.15(USIM_DATA) R33.2
NetM1_16: M1.16(USIM_CLK) R29.2
NetM1_17: M1.17(USIM_RST) R25.2
NetM1_39: M1.39(PWRKEY) R36.2
NetM1_41: M1.41(NETLIGHT) R35.1
NetM1_42: M1.42(STATUS) R47.1
NetNC1_2: NC1.2 NC2.1
NetP1_12: P1.12(K1) R34.1
NetP1_14: P1.14(A2) R28.1
NetQ2_1: Q2.1(B) R35.2 R38.2
NetQ2_3: Q2.3(C) R31.1
NetQ3_1: Q3.1(B) R43.2 R44.2
NetQ5_1: Q5.1(B) R47.2 R48.2
NetQ5_3: Q5.3(C) R46.1
NetQ6_1: Q6.1(B) R56.2 R57.2
NetQ6_3: Q6.3(C) R55.2 U5.4(SD_MODE)
NetQ9_1: Q9.1(G) R79.2 R83.2
NetQ9_3: Q9.3(D) R78.1
NetR8_1: R8.1 U4.45(PMODE0)
NetR9_1: R9.1 U4.44(PMODE1)
NetR10_2: R10.2 U4.1(TXN)
NetR11_1: R11.1 U4.43(PMODE2)
NetR12_2: R12.2 U4.2(TXP)
NetR13_1: R13.1 U4.42(RSVD)
NetR16_1: R16.1 U4.41(RSVD)
NetR17_2: R17.2 U4.5(RXN)
NetR18_1: R18.1 U4.40(RSVD)
NetR19_1: R19.1 U4.39(RSVD)
NetR20_2: R20.2 U4.6(RXP)
NetR24_1: R24.1 U4.38(RSVD)
NetR27_2: R27.2 U4.10(EXRES1)
NetR37_2: R37.2 U4.23(RSVD)

Not connected (* = marked no-connect by the designer): H1 1*; H2 1*; H3 1*; H4 1*; IC2 1(32KHZ)* 3(SQW/~{INT})*; J1 C6(VPP)*; M1 3(RTS)* 4(CTS)* 5(DCD)* 6(DTR)* 7(RI)* 9(MIC_P)* 10(MIC_N)* 11(SPK_P)* 12(SPK_N)* 20(USB_BOOT)* 22(UART3_TXD)* 23(UART3_RXD)* 24(USB_VBUS)* 25(USB_DP)* 26(USB_DN)* 28(NC)* 38(ADC1)* 43(RESERVED)* 44(RESERVED)* 45(RESERVED)* 46(RESERVED)* 47(RESERVED)* 48(RESERVED)* 49(RESERVED)* 50(RESERVED)* 51(RESERVED)* 52(RESERVED)* 53(RESERVED)* 54(RESERVED)* 55(RESERVED)* 56(RESERVED)* 57(RESERVED)* 58(DBG_RXD)* 59(DBG_TXD)* 60(RESERVED)* 61(RESERVED)* 62(RESERVED)* 63(RESERVED)* 64(RESERVED)* 65(RESERVED)* 66(RESERVED)* 67(RESERVED)* 68(RESERVED)* 69(RESERVED)* 70(RESERVED)* 71(RESERVED)* 72(RESERVED)* 73(RESERVED)* 74(RESERVED)* 75(RESERVED)* 76(RESERVED)* 77(RESERVED)* 78(RESERVED)* 79(RESERVED)* 80(RESERVED)* 81(RESERVED)* 82(RESERVED)* 83(RESERVED)* 84(RESERVED)* 85(RESERVED)* 86(RESERVED)*; P1 9(PWR+)* 10(PWR-)*; SD1 10B*; U3 6(IN_6)* 7(IN_7)* 10(OUT_7)* 11(OUT_6)*; U4 7(DNC)* 12(NC)* 13(NC)* 18(VBG)* 24(SPDLED)* 26(DUPLED)* 46(NC)* 47(NC)*; U7 10(P5)* 11(P6)* 12(P7)* 13(~{INT})*; U8 10(P5)* 11(P6)* 12(P7)*; U9 28(IO35) 29(IO36) 30(IO37) 32(IO39) 33(IO40)

## Notes on the sheet
- ETHERNET
- MODULE SIM
- ULN2003
- Relay
- EEPROM
- ESP32
- PCF8574AT_IO
- SPEAKER
- LCD I2C
- REALTIME
- SW BIT
- INPUT
- OUTPUT
- LCD SPI
- (near R81) Con trở này hàn để DEBUG mạch (DEBUG xong tháo ra)
- Labels drawn without touching a wire or pin: CS
- DWG. NO.
- REV.
- SHT.
- REVISION
- DESCRIPTION
- DATE
- APPROVED
- THIS DOCUMENT AND THE DATA DISCLOSED HEREIN OR HEREWITH IS THE PROPERTY OF ALTIUM LIMITED AND MAY BE FREELY DISTRIBUTED IN WHOLE. NO RIGHTS ARE RESERVED OR EXPRESS OR IMPLIED WARANTEE GIVEN.
- ENG:
- DSN:
- APPROVALS
- PROJECT
- DOCUMENT REVISION:
- DESIGN ITEM:
- CHK:
- BOM:
- REFERENCE DOCUMENTS
- PROJECT REVISION:
- TITLE
- FAB DWG:
- PCB DWG:
- ASSY DWG:
- SCALE:
- SIZE
- D
- CAGE CODE
- FILE NAME
- DWG NO.
- SHEET
- OF
- REV
- (in symbol CAP_ALU_SMD; 100UF 20% 16V 6.3x5.5MM) +
- (in symbol CAP_CER_SMD; 6.8nF 50V C0G/NP0 0805 5%) X7R
- (in symbol CAP_CER_SMD; 10PF 50V C0G/NP0 0805 2.5%) X5R
- (in symbol CAP_CER_SMD; 22nF 50V C0G/NP0 0805 5%) X7R
- (in symbol CAP_CER_SMD; 22PF 50V C0G/NP0 0805 5%_1) X7R
- (in symbol CAP_CER_SMD; 33PF 50V C0G/NP0 0805 10%) X7R
- (in symbol CAP_CER_SMD; 100PF 50V C0G/NP0 0805 10%) 0805; C0G
- (in symbol CAP_CER_SMD; 220PF 50V C0G/NP0 0805 10%_1) 0805; C0G
- (in symbol CAP_CER_SMD; 470PF 50V C0G/NP0 0805 5%) C0G
- (in symbol MCU_SMD;ESP32-S3-WROOM-1(N16R8)) XUAN SIEU LIB
- (in symbol RES_SMD; 0R 5% 1/8W 0805) 0805
- (in symbol RES_SMD; 1K, 1%, 0805, 1/8W) 0805
- (in symbol RES_SMD; 4.7K, 1%, 0805, 1/8W) 0805
- (in symbol RES_SMD; 10K, 1%, 0805, 1/8W) 0805
- (in symbol RES_SMD; 10R, 1%, 0805, 1/8W_1_1) 0805
- (in symbol RES_SMD; 12.1K, 1%, 0805, 1/8W_1) 0805
- (in symbol RES_SMD; 22R, 1%, 0805, 1/8W) 0805
- (in symbol RES_SMD; 33R, 1%, 0805, 1/8W_1) 0805
- (in symbol RES_SMD; 49.9R, 1%, 0805, 1/8W_1_1) 0805
- (in symbol RES_SMD; 330R, 1%, 0805, 1/8W) 0805
- (in symbol RJ45-HY931147C) G; Y
- (in symbol SWDIP10) OFF; ON